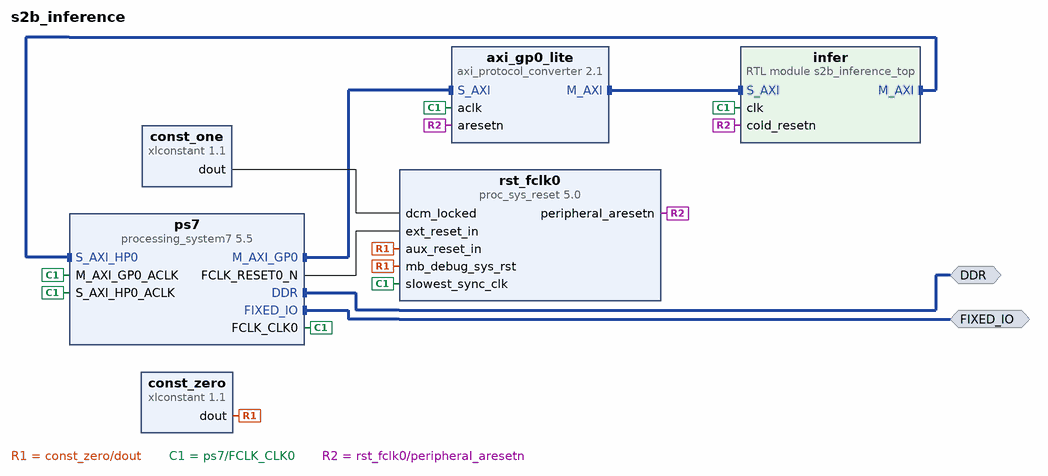
[diagram p0: block diagram of the top level]
# Vivado block design s2b_inference, xc7z020clg400-2, Vivado 2026.1
create_bd_design s2b_inference

create_bd_intf_port -mode Master -vlnv xilinx.com:interface:ddrx_rtl:1.0 DDR
create_bd_intf_port -mode Master -vlnv xilinx.com:display_processing_system7:fixedio_rtl:1.0 FIXED_IO

create_bd_cell -type ip -vlnv xilinx.com:ip:processing_system7:5.5 ps7
set_property -dict [list \
  CONFIG.PCW_FPGA0_PERIPHERAL_FREQMHZ 50 \
  CONFIG.PCW_PRESET_BANK1_VOLTAGE {LVCMOS 1.8V} \
  CONFIG.PCW_UART1_PERIPHERAL_ENABLE 1 \
  CONFIG.PCW_UART1_UART1_IO {MIO 48 .. 49} \
  CONFIG.PCW_UART_PERIPHERAL_FREQMHZ 100 \
  CONFIG.PCW_UIPARAM_DDR_FREQ_MHZ 533.333333 \
  CONFIG.PCW_UIPARAM_DDR_PARTNO {MT41J256M16 RE-125} \
  CONFIG.PCW_USE_S_AXI_HP0 1 \
] [get_bd_cells ps7]
# 78 more settings of ps7 are not shown: defaults, MIO pin electricals, DDR timing, and values the tool derives
create_bd_cell -type ip -vlnv xilinx.com:ip:axi_protocol_converter:2.1 axi_gp0_lite
set_property -dict [list \
  CONFIG.ADDR_WIDTH 32 \
  CONFIG.DATA_WIDTH 32 \
  CONFIG.ID_WIDTH 12 \
  CONFIG.MI_PROTOCOL AXI4LITE \
  CONFIG.SI_PROTOCOL AXI3 \
  CONFIG.TRANSLATION_MODE 0 \
] [get_bd_cells axi_gp0_lite]
create_bd_cell -type ip -vlnv xilinx.com:ip:proc_sys_reset:5.0 rst_fclk0
set_property -dict {CONFIG.C_AUX_RESET_HIGH 1 CONFIG.C_EXT_RESET_HIGH 0} [get_bd_cells rst_fclk0]
create_bd_cell -type ip -vlnv xilinx.com:ip:xlconstant:1.1 const_zero
set_property -dict {CONFIG.CONST_VAL 0 CONFIG.CONST_WIDTH 1} [get_bd_cells const_zero]
create_bd_cell -type ip -vlnv xilinx.com:ip:xlconstant:1.1 const_one
set_property -dict {CONFIG.CONST_VAL 1 CONFIG.CONST_WIDTH 1} [get_bd_cells const_one]
create_bd_cell -type module -reference s2b_inference_top infer
set_property -dict {CONFIG.PROFILE_VISIBILITY_PROVEN 1} [get_bd_cells infer]

# ---- connections ----

connect_bd_intf_net [get_bd_intf_pins axi_gp0_lite/M_AXI] [get_bd_intf_pins infer/S_AXI]
connect_bd_intf_net [get_bd_intf_pins infer/M_AXI] [get_bd_intf_pins ps7/S_AXI_HP0]
connect_bd_intf_net [get_bd_intf_ports DDR] [get_bd_intf_pins ps7/DDR]
connect_bd_intf_net [get_bd_intf_ports FIXED_IO] [get_bd_intf_pins ps7/FIXED_IO]
connect_bd_intf_net [get_bd_intf_pins ps7/M_AXI_GP0] [get_bd_intf_pins axi_gp0_lite/S_AXI]
connect_bd_net [get_bd_pins const_one/dout] [get_bd_pins rst_fclk0/dcm_locked]
connect_bd_net [get_bd_pins const_zero/dout] [get_bd_pins rst_fclk0/aux_reset_in] [get_bd_pins rst_fclk0/mb_debug_sys_rst]
connect_bd_net [get_bd_pins ps7/FCLK_CLK0] \
  [get_bd_pins ps7/M_AXI_GP0_ACLK] [get_bd_pins ps7/S_AXI_HP0_ACLK] [get_bd_pins axi_gp0_lite/aclk] \
  [get_bd_pins rst_fclk0/slowest_sync_clk] [get_bd_pins infer/clk]
connect_bd_net [get_bd_pins ps7/FCLK_RESET0_N] [get_bd_pins rst_fclk0/ext_reset_in]
connect_bd_net [get_bd_pins rst_fclk0/peripheral_aresetn] [get_bd_pins axi_gp0_lite/aresetn] [get_bd_pins infer/cold_resetn]

# ---- address map ----
assign_bd_address -offset 0x00000000 -range 1G -target_address_space [get_bd_addr_spaces infer/M_AXI] [get_bd_addr_segs ps7/S_AXI_HP0/HP0_DDR_LOWOCM]
assign_bd_address -offset 0x43C00000 -range 64K -target_address_space [get_bd_addr_spaces ps7/Data] [get_bd_addr_segs infer/S_AXI/reg0]

validate_bd_design
save_bd_design
